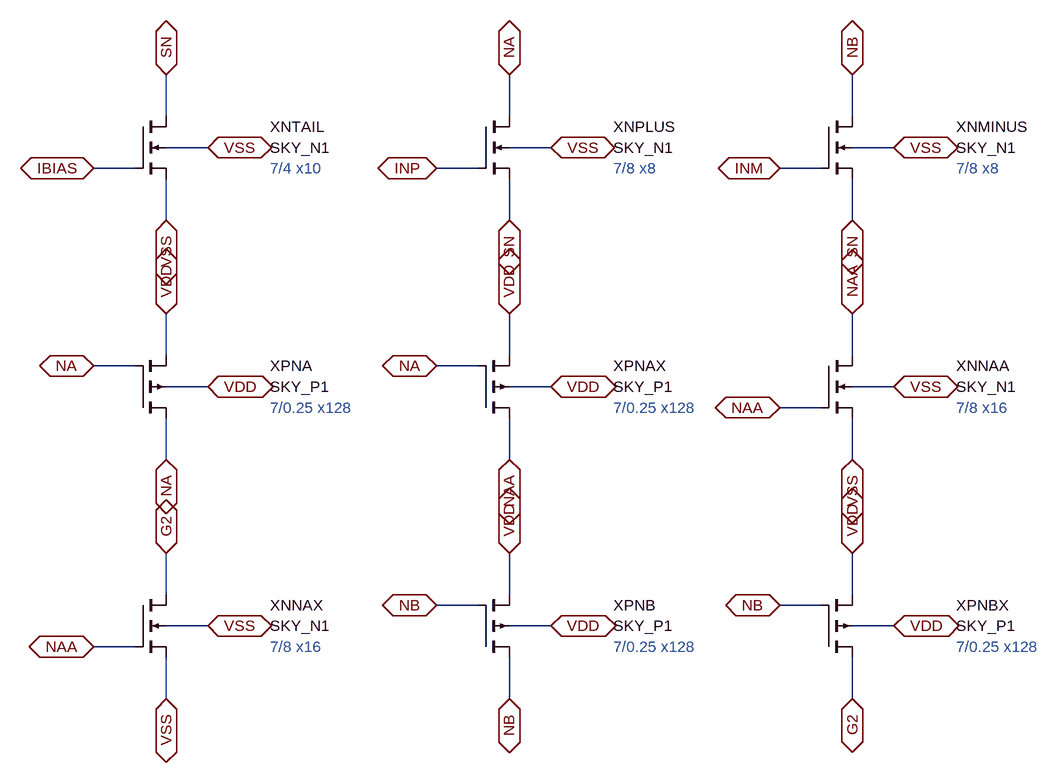
[diagram p0: schematic Sky_InputN.asc]
Sky_InputN.asc, the LTspice schematic file:
Version 4.1
SHEET 1 1728 1408
WIRE 208 160 208 96
WIRE 160 240 96 240
WIRE 208 256 208 320
WIRE 208 208 272 208
WIRE 736 160 736 96
WIRE 688 240 624 240
WIRE 736 256 736 320
WIRE 736 208 800 208
WIRE 1264 160 1264 96
WIRE 1216 240 1152 240
WIRE 1264 256 1264 320
WIRE 1264 208 1328 208
WIRE 208 624 208 688
WIRE 160 544 96 544
WIRE 208 528 208 464
WIRE 208 576 272 576
WIRE 736 624 736 688
WIRE 688 544 624 544
WIRE 736 528 736 464
WIRE 736 576 800 576
WIRE 1264 528 1264 464
WIRE 1216 608 1152 608
WIRE 1264 624 1264 688
WIRE 1264 576 1328 576
WIRE 208 896 208 832
WIRE 160 976 96 976
WIRE 208 992 208 1056
WIRE 208 944 272 944
WIRE 736 992 736 1056
WIRE 688 912 624 912
WIRE 736 896 736 832
WIRE 736 944 800 944
WIRE 1264 992 1264 1056
WIRE 1216 912 1152 912
WIRE 1264 896 1264 832
WIRE 1264 944 1328 944
FLAG 208 96 SN
IOPIN 208 96 BiDir
FLAG 96 240 IBIAS
IOPIN 96 240 BiDir
FLAG 208 320 VSS
IOPIN 208 320 BiDir
FLAG 272 208 VSS
IOPIN 272 208 BiDir
FLAG 736 96 NA
IOPIN 736 96 BiDir
FLAG 624 240 INP
IOPIN 624 240 BiDir
FLAG 736 320 SN
IOPIN 736 320 BiDir
FLAG 800 208 VSS
IOPIN 800 208 BiDir
FLAG 1264 96 NB
IOPIN 1264 96 BiDir
FLAG 1152 240 INM
IOPIN 1152 240 BiDir
FLAG 1264 320 SN
IOPIN 1264 320 BiDir
FLAG 1328 208 VSS
IOPIN 1328 208 BiDir
FLAG 208 688 NA
IOPIN 208 688 BiDir
FLAG 96 544 NA
IOPIN 96 544 BiDir
FLAG 208 464 VDD
IOPIN 208 464 BiDir
FLAG 272 576 VDD
IOPIN 272 576 BiDir
FLAG 736 688 NAA
IOPIN 736 688 BiDir
FLAG 624 544 NA
IOPIN 624 544 BiDir
FLAG 736 464 VDD
IOPIN 736 464 BiDir
FLAG 800 576 VDD
IOPIN 800 576 BiDir
FLAG 1264 464 NAA
IOPIN 1264 464 BiDir
FLAG 1152 608 NAA
IOPIN 1152 608 BiDir
FLAG 1264 688 VSS
IOPIN 1264 688 BiDir
FLAG 1328 576 VSS
IOPIN 1328 576 BiDir
FLAG 208 832 G2
IOPIN 208 832 BiDir
FLAG 96 976 NAA
IOPIN 96 976 BiDir
FLAG 208 1056 VSS
IOPIN 208 1056 BiDir
FLAG 272 944 VSS
IOPIN 272 944 BiDir
FLAG 736 1056 NB
IOPIN 736 1056 BiDir
FLAG 624 912 NB
IOPIN 624 912 BiDir
FLAG 736 832 VDD
IOPIN 736 832 BiDir
FLAG 800 944 VDD
IOPIN 800 944 BiDir
FLAG 1264 1056 G2
IOPIN 1264 1056 BiDir
FLAG 1152 912 NB
IOPIN 1152 912 BiDir
FLAG 1264 832 VDD
IOPIN 1264 832 BiDir
FLAG 1328 944 VDD
IOPIN 1328 944 BiDir
SYMBOL nmos4 160 160 R0
WINDOW 0 208 16 Left 2
WINDOW 3 208 48 Left 2
SYMATTR InstName XNTAIL
SYMATTR Value SKY_N1
SYMATTR SpiceLine w=7 l=4 mult=10
SYMATTR Prefix X
SYMBOL nmos4 688 160 R0
WINDOW 0 208 16 Left 2
WINDOW 3 208 48 Left 2
SYMATTR InstName XNPLUS
SYMATTR Value SKY_N1
SYMATTR SpiceLine w=7 l=8 mult=8
SYMATTR Prefix X
SYMBOL nmos4 1216 160 R0
WINDOW 0 208 16 Left 2
WINDOW 3 208 48 Left 2
SYMATTR InstName XNMINUS
SYMATTR Value SKY_N1
SYMATTR SpiceLine w=7 l=8 mult=8
SYMATTR Prefix X
SYMBOL pmos4 160 624 M180
WINDOW 0 208 80 Left 2
WINDOW 3 208 48 Left 2
SYMATTR InstName XPNA
SYMATTR Value SKY_P1
SYMATTR SpiceLine w=7 l=0.25 mult=128
SYMATTR Prefix X
SYMBOL pmos4 688 624 M180
WINDOW 0 208 80 Left 2
WINDOW 3 208 48 Left 2
SYMATTR InstName XPNAX
SYMATTR Value SKY_P1
SYMATTR SpiceLine w=7 l=0.25 mult=128
SYMATTR Prefix X
SYMBOL nmos4 1216 528 R0
WINDOW 0 208 16 Left 2
WINDOW 3 208 48 Left 2
SYMATTR InstName XNNAA
SYMATTR Value SKY_N1
SYMATTR SpiceLine w=7 l=8 mult=16
SYMATTR Prefix X
SYMBOL nmos4 160 896 R0
WINDOW 0 208 16 Left 2
WINDOW 3 208 48 Left 2
SYMATTR InstName XNNAX
SYMATTR Value SKY_N1
SYMATTR SpiceLine w=7 l=8 mult=16
SYMATTR Prefix X
SYMBOL pmos4 688 992 M180
WINDOW 0 208 80 Left 2
WINDOW 3 208 48 Left 2
SYMATTR InstName XPNB
SYMATTR Value SKY_P1
SYMATTR SpiceLine w=7 l=0.25 mult=128
SYMATTR Prefix X
SYMBOL pmos4 1216 992 M180
WINDOW 0 208 80 Left 2
WINDOW 3 208 48 Left 2
SYMATTR InstName XPNBX
SYMATTR Value SKY_P1
SYMATTR SpiceLine w=7 l=0.25 mult=128
SYMATTR Prefix X
TEXT 368 240 Left 2 ;7/4 x10
TEXT 896 240 Left 2 ;7/8 x8
TEXT 1424 240 Left 2 ;7/8 x8
TEXT 368 608 Left 2 ;7/0.25 x128
TEXT 896 608 Left 2 ;7/0.25 x128
TEXT 1424 608 Left 2 ;7/8 x16
TEXT 368 976 Left 2 ;7/8 x16
TEXT 896 976 Left 2 ;7/0.25 x128
TEXT 1424 976 Left 2 ;7/0.25 x128

The netlist it stands for:
* Sky_InputN.asc
X§XNTAIL SN IBIAS VSS VSS SKY_N1 w=7 l=4 mult=10  ; pins D G S B
X§XNPLUS NA INP SN VSS SKY_N1 w=7 l=8 mult=8  ; pins D G S B
X§XNMINUS NB INM SN VSS SKY_N1 w=7 l=8 mult=8  ; pins D G S B
X§XPNA NA NA VDD VDD SKY_P1 w=7 l=0.25 mult=128  ; pins D G S B
X§XPNAX NAA NA VDD VDD SKY_P1 w=7 l=0.25 mult=128  ; pins D G S B
X§XNNAA NAA NAA VSS VSS SKY_N1 w=7 l=8 mult=16  ; pins D G S B
X§XNNAX G2 NAA VSS VSS SKY_N1 w=7 l=8 mult=16  ; pins D G S B
X§XPNB NB NB VDD VDD SKY_P1 w=7 l=0.25 mult=128  ; pins D G S B
X§XPNBX G2 NB VDD VDD SKY_P1 w=7 l=0.25 mult=128  ; pins D G S B
* 7/4 x10
* 7/8 x8
* 7/8 x8
* 7/0.25 x128
* 7/0.25 x128
* 7/8 x16
* 7/8 x16
* 7/0.25 x128
* 7/0.25 x128
.backanno
.end